# Altium schematic sheet E-O Converter.SchDoc
size 406 x 304 mm; SheetNumber: 7; SheetTotal: 8
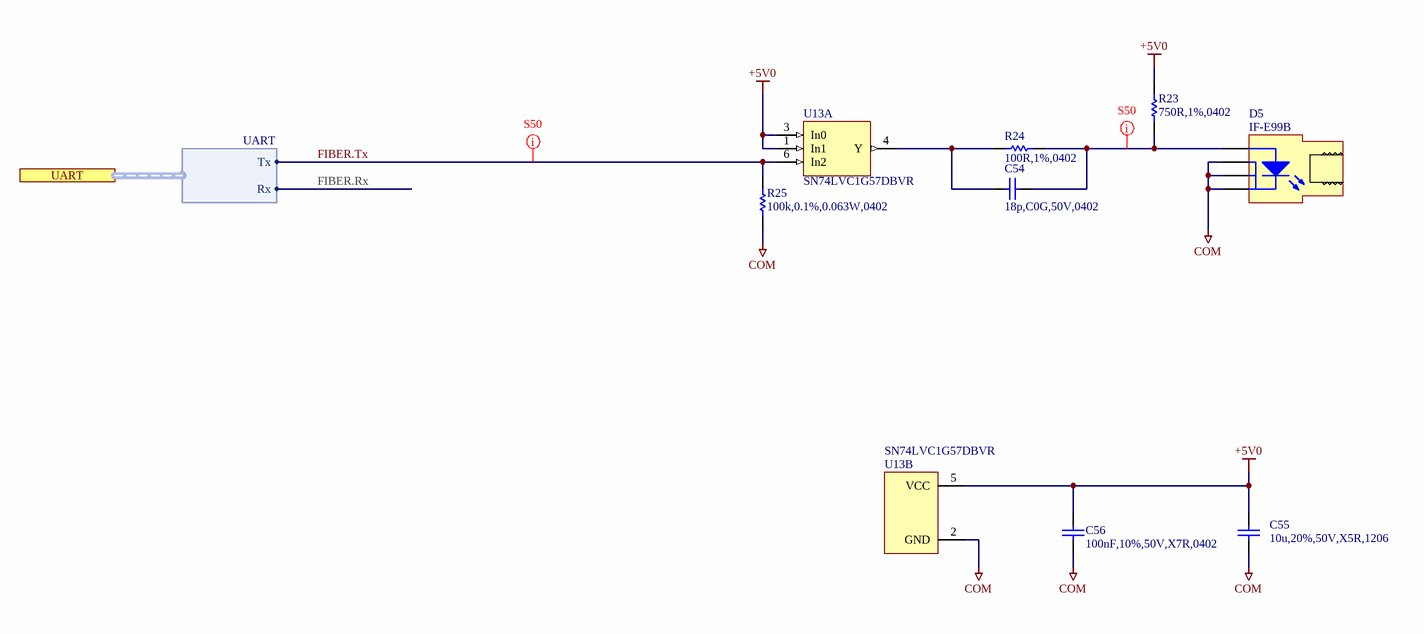
[diagram p0: E-O Converter.SchDoc]

## Parts
C54  18p,C0G,50V,0402  [CAPC1005X06N]
C55  10u,20%,50V,X5R,1206  [CAPC3216X16N]
C56  100nF,10%,50V,X7R,0402  [CAPC1005X06N]
D5  IF-E99B  [INDUSTRIALFIBEROPTICS_IF-E99B]
R23  750R,1%,0402  [RESC1005X04N]
R24  100R,1%,0402  [RESC1005X04N]
R25  100k,0.1%,0.063W,0402  [RESC1005X04N]
U13  SN74LVC1G57DBVR  [TEXASINSTRUMENTS_PKG_DBV0006A]  (parts A,B of 2)

## Ports
UART (harness UART)

## Harnesses
UART: Tx, Rx

## Nets
+5V0: C55.2 C56.1 R23.2 U13.1(In1) U13.3(In0) U13.5(VCC)
COM: C55.1 C56.2 D5.1(K) D5.2(K) D5.4(K) R25.2 U13.2(GND)
FIBER.Rx: port UART.Rx
FIBER.Tx: R25.1 U13.6(In2) ; port UART.Tx
NetC54_1: C54.1 R24.1 U13.4(Y)
NetC54_2: C54.2 D5.3(A) R23.1 R24.2

## Layout directives
net class S50: FIBER.Tx, NetC54_2

## Notes on the sheet
- Rev
- Sheet Name:
- Date:
- Sheet
- Designer:
- of

## Library data of the parts
C54 = 106-00106: CAP,18p,C0G,50V,0402; Manufacturer1: Murata Manufacturing Company, Ltd.; Manufacturer1PartNumber: GRM1555C1H180JA01D; State: Approved; Part Number: 106-00106; CreatedBy: Kevin Riebs (admin); HelpURL: C:\KVault\Products\Electrical OTS Parts\Datasheets\Murata\GRM1555C1H180JA01D.pdf; Value: 18p; Changed Date: 2026-03-25T20:02:10-07:00; ComponentLink1URL: http://k1plm09.kardium.local/Windchill/app/#ptc1/tcomp/infoPage?ContainerOid=OR:wt.inf.library.WTLibrary:31712871&oid=OR:wt.part.WTPart:123155911&u8=1; ComponentLink1Description: PLM Part Link
C55 = CAP,Cer,10uF,50VDC,X5R,1206: 10ï¿½F ï¿½20% 50V Ceramic Capacitor X5R 1206 (3216 Metric); Manufacturer 1: Samsung Electro-Mechanics; Manufacturer 1 Part Number: CL31A106MBHNNNE; Vendor 1 Part Number: 1276-6736-1-ND; Vendor 1: Digikey; Part Name: CAP,Cer,10uF,50VDC,X5R,1206; CreatedBy: Judd Foster; HelpURL: https://www.samsungsem.com/resources/file/global/support/product_catalog/MLCC.pdf; Value: 10u
C56 = CAP,Cer,100nF,10%,50V,X7R,0402: 50V 100nF X7R Â±10% 0402 Ceramic Capacitors ROHS; Manufacturer 1: Murata; Manufacturer 1 Part Number: GRM155R71H104KE14D; Vendor 1 Part Number: C77020; Vendor 1: LCSC; Value: 100n; Part Name: CAP,Cer,100nF,10%,50V,X7R,0402; CreatedBy: Judd Foster; HelpURL: https://www.lcsc.com/datasheet/C77020.pdf
D5 = XMITTER,FIBER OPTIC,650NM,1.9V,IF-E99B: Fiber Optic Transmitter 650nm 1.9V 50 mA Connector-less; Manufacturer 1: Industrial Fiber Optics; Vendor 1 Part Number: FB161-ND; Vendor 1: DigiKey; Part Name: XMITTER,FIBER OPTIC,650NM,1.9V,IF-E99B; CreatedBy: Judd Foster; HelpURL: https://i-fiberoptics.com/pdf/if-e99bdatasheet.pdf; Manufacturer 1 Part Number: IF-E99B
R23 = 106-00004: RES,750R,1%,0.063W,0402; Manufacturer1: Panasonic Corporation; Manufacturer1PartNumber: ERJ-2RKF7500X; Value: 750; State: Approved; Part Number: 106-00004; CreatedBy: Kevin Riebs (admin); HelpURL: C:\KVault\Products\Electrical OTS Parts\Datasheets\Panasonic\ERJ-2RKF7500X.pdf; Changed Date: 2026-03-25T20:02:47-07:00; ComponentLink1URL: http://k1plm09.kardium.local/Windchill/app/#ptc1/tcomp/infoPage?ContainerOid=OR:wt.inf.library.WTLibrary:31712871&oid=OR:wt.part.WTPart:123166926&u8=1; ComponentLink1Description: PLM Part Link
R24 = 106-00003: RES,100R,1%,0.063W,0402; Manufacturer1: Panasonic Corporation; Manufacturer1PartNumber: ERJ-2RKF1000X; Value: 100; State: Approved; Part Number: 106-00003; CreatedBy: Kevin Riebs (admin); HelpURL: C:\KVault\Products\Electrical OTS Parts\Datasheets\Panasonic\ERJ-2RKF1000X.pdf; Changed Date: 2026-03-25T20:11:41-07:00; ComponentLink1URL: http://k1plm09.kardium.local/Windchill/app/#ptc1/tcomp/infoPage?ContainerOid=OR:wt.inf.library.WTLibrary:31712871&oid=OR:wt.part.WTPart:123239745&u8=1; ComponentLink1Description: PLM Part Link
R25 = RES,100k,0.1%,0.063W,0402: 100 kOhms ï¿½0.1% 0.063W, 1/16W Chip Resistor 0402 (1005 Metric) Thin Film; Manufacturer 1: YAGEO; Manufacturer 1 Part Number: RT0402BRE07100KL; Vendor 1 Part Number: YAG2304CT-ND; Vendor 1: Digikey; Part Name: RES,100k,0.1%,0.063W,0402; CreatedBy: Judd Foster; HelpURL: https://www.yageo.com/upload/media/product/app/datasheet/rchip/pyu-rt_1-to-0.01_rohs_l.pdf; Value: 100k
U13 = 106-05785: IC,Logic,Configurable,SOT23,SN74LVC1G57DBVR; Manufacturer1: Texas Instruments Incorporated; State: Approved; Part Number: 106-05785; CreatedBy: Kevin Heyer; HelpURL: C:\KVault\Products\Electrical OTS Parts\Datasheets\Texas Instruments\SN74LVC1G57DBVR.pdf; Manufacturer1PartNumber: SN74LVC1G57DBVR; Changed Date: 2026-03-19T12:12:39-07:00; ComponentLink1URL: http://k1plm09.kardium.local/Windchill/app/#ptc1/tcomp/infoPage?ContainerOid=OR:wt.inf.library.WTLibrary:31712871&oid=OR:wt.part.WTPart:122961633&u8=1; ComponentLink1Description: PLM Part Link